# Altium schematic sheet Ethernet-PoE-Sheet.SchDoc (part 3 of 3)
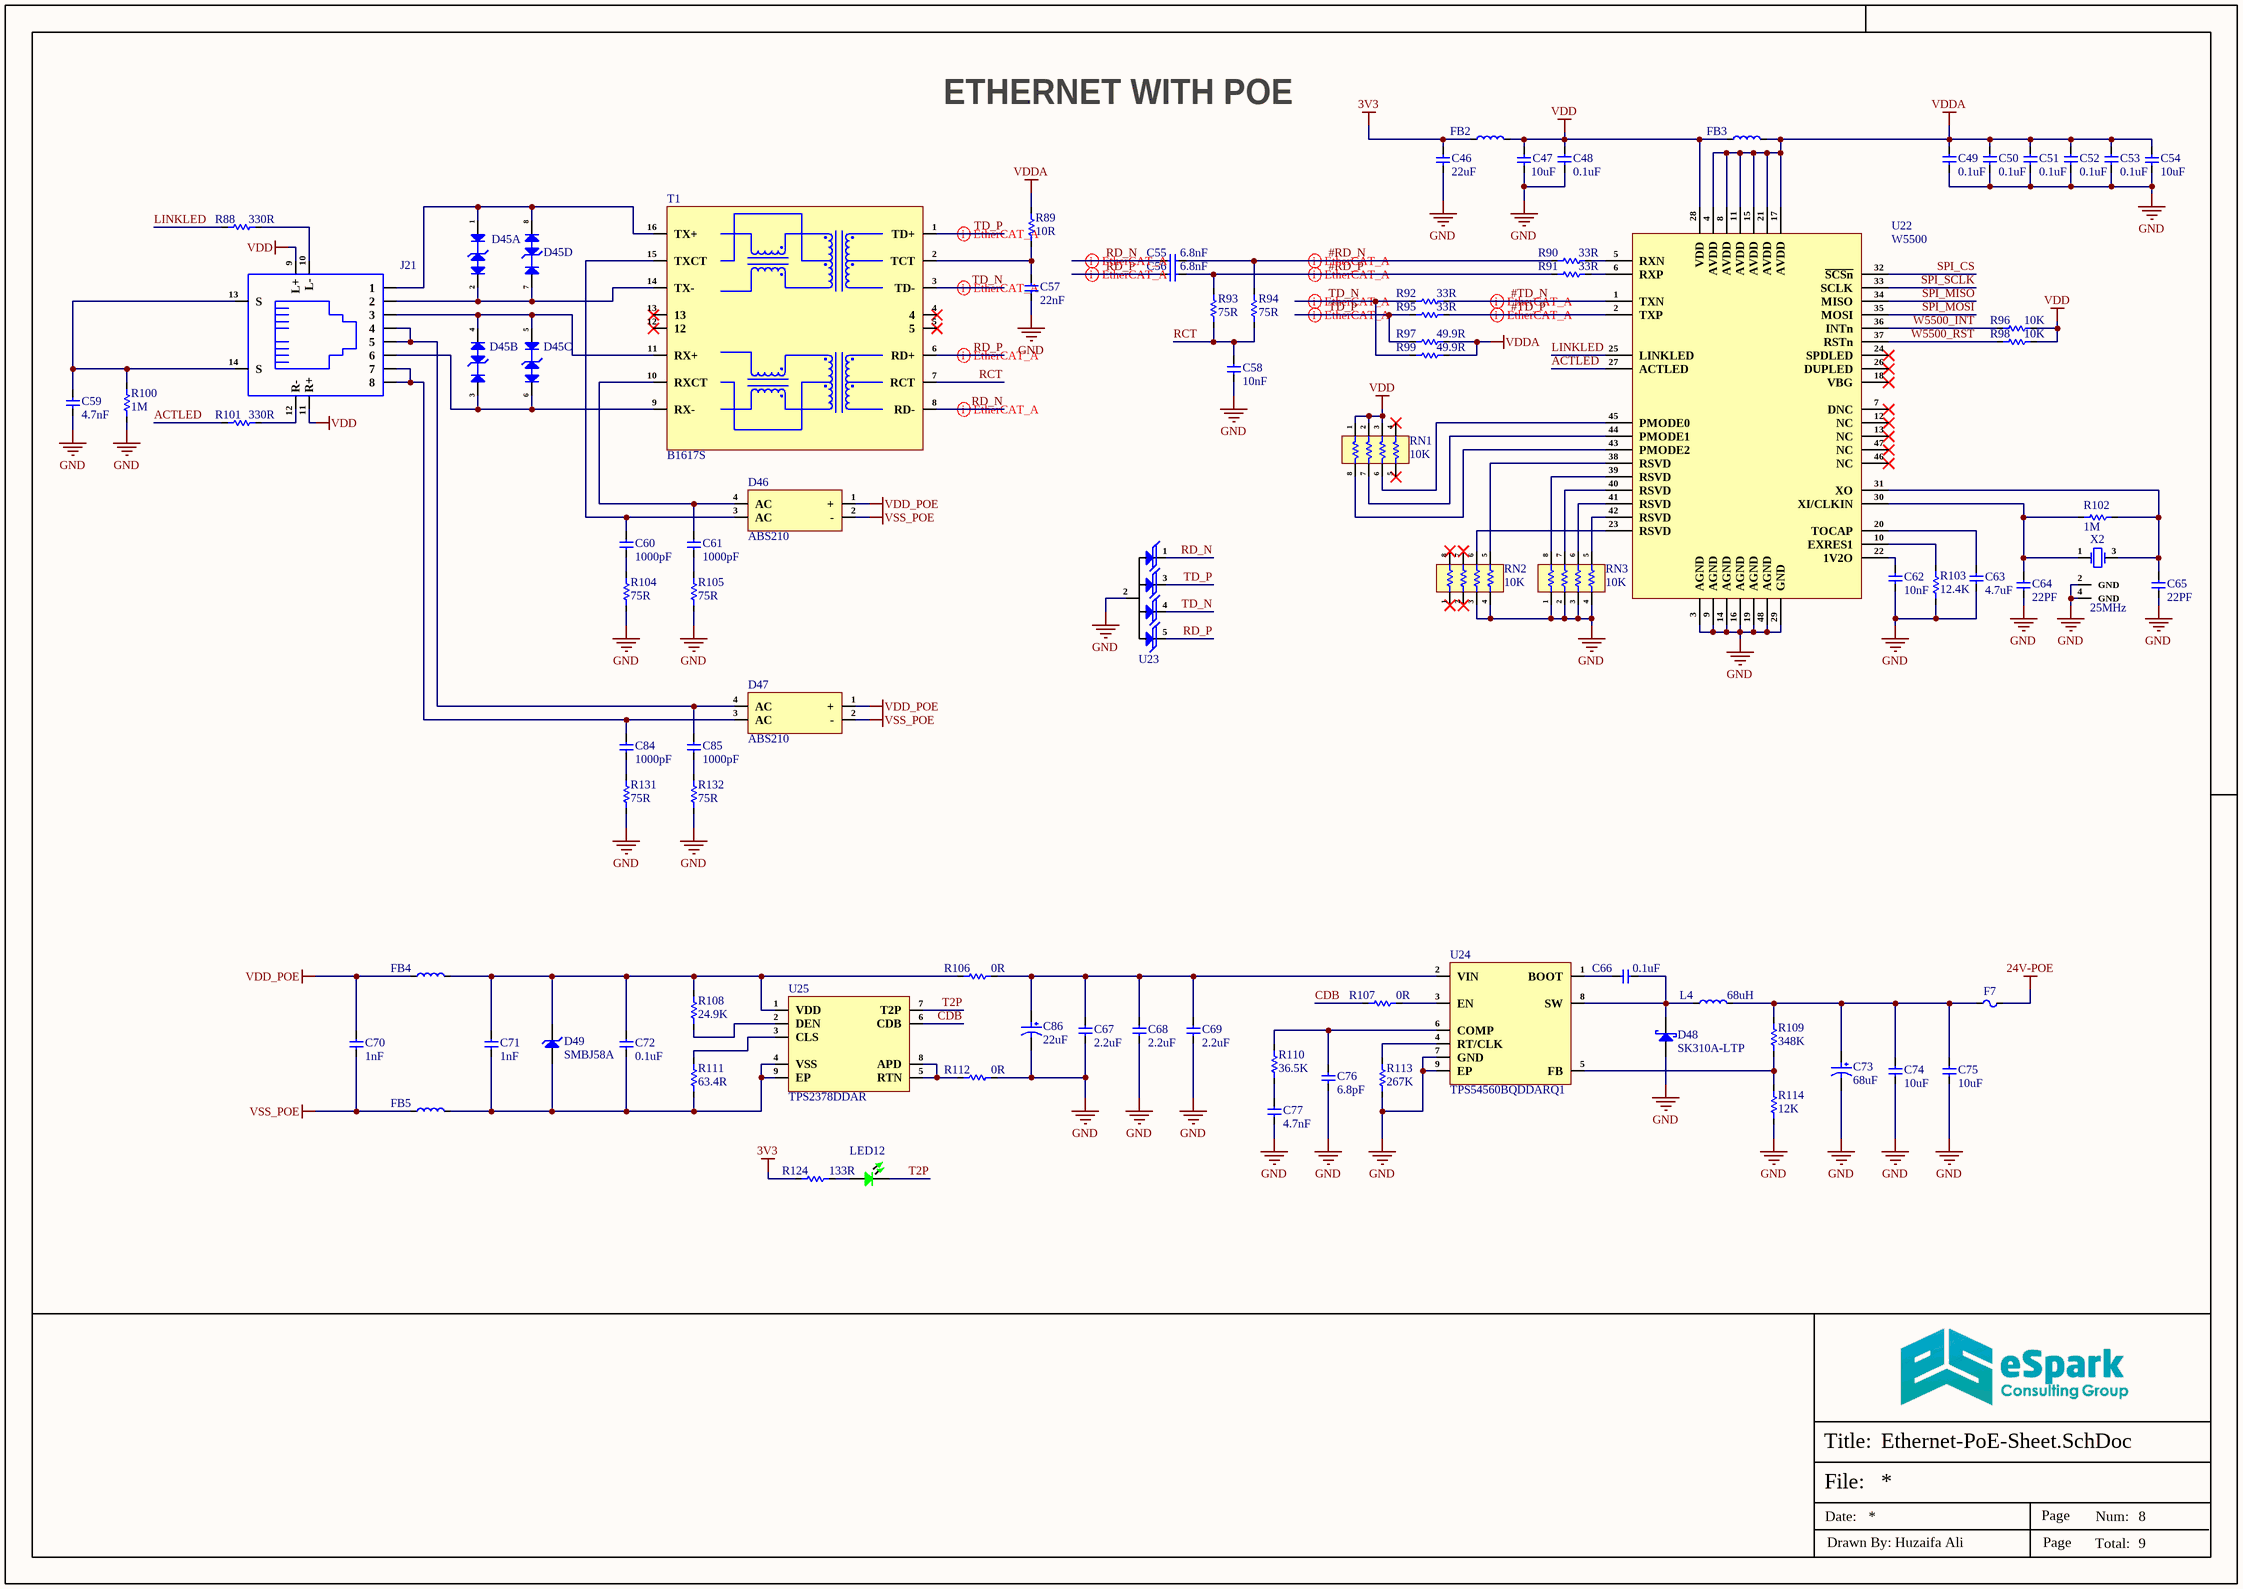
[diagram p2: Ethernet-PoE-Sheet.SchDoc]

## Library data of the parts (continued)
R102 = RK73H1ETTP1004F: Res Thick Film 0402 1M Ohm 1% 0.1W(1/10W) ±100ppm/C Pad SMD Automotive T/R; Manufacturer: KOA Speer; Resistance: 1MR; Power Rating: 63mW; Voltage Rating: 50V; Temperature Coefficient: 100ppm/°C; Max Power Dissipation: 100mW; Item Type: Resistor; Supplier 1: Rs; Manufacturer Part Number: RK73H1ETTP1004F; RoHS: Yes; Category: Chip SMD Resistors; Stock 1: 29500; Pricing 1: 100=0.003, 1000=0.006, 2500=0.005, 5000=0.005, 10000=0.004 (GBP); Mount: Surface Mount; Case/Package: 0402; Case Code (Imperial): 0402; Case Code (Metric): 1005; Min Operating Temperature: -55°C; Max Operating Temperature: 155°C; Packaging: Tape and Reel; Tolerance: 1%; Package Quantity: 10000; Termination: SMD/SMT; Series: RK73H; Construction: Rectangular; Technology: THICK FILM; Features: Moisture Resistant,Automotive AEC-Q200; Number of Terminations: 2; Voltage Rating (DC): 50V; Length: 1mm; Width: 0.5mm; Height: 0.35mm; Depth: 0.5mm; Ratings: AEC-Q200; Military Standard: Not; RoHS Compliant: Yes; Lead Free: 5697LeadFree; ComponentLink1URL: http://www.jameco.com/Jameco/Products/ProdDS/1882463.pdf?src-supplier=Jameco; ComponentLink1Description: http://www.jameco.com/Jameco/Products/ProdDS/1882463.pdf?src-supplier=Jameco; ComponentLink2URL: http://components.arrow.com/part/dataview/39721833S6492602N5146?src-supplier=Arrow+Electronics; ComponentLink2Description: http://components.arrow.com/part/dataview/39721833S6492602N5146?src-supplier=Arrow+Electronics; ComponentLink3URL: https://datasheet.octopart.com/RK73H1ETTP1004F-KOA-Speer-datasheet-149653815.pdf?src-supplier=Farnell; ComponentLink3Description: https://datasheet.octopart.com/RK73H1ETTP1004F-KOA-Speer-datasheet-149653815.pdf?src-supplier=Farnell; ComponentLink4URL: http://www.koaspeer.com/catimages/Products/RK73H/RK73H.pdf?src-supplier=Mouser; ComponentLink4Description: http://www.koaspeer.com/catimages/Products/RK73H/RK73H.pdf?src-supplier=Mouser; ComponentLink5URL: https://www.verical.com/server-webapp/html/getDatasheet?partID=139303&src-supplier=Verical; ComponentLink5Description: https://www.verical.com/server-webapp/html/getDatasheet?partID=139303&src-supplier=Verical; LCSC Part Number: C159943
R103 = RC0603FR-0712K4L: RES SMD 12.4K OHM 1% 1/10W 0603; Manufacturer: Yageo; Resistance: 12.4kR; Power Rating: 100mW; Voltage Rating: 50V; Temperature Coefficient: 100ppm/°C; Working Voltage: 75V; Supplier 1: Digi-Key; Manufacturer Part Number: RC0603FR-0712K4L; RoHS: Yes; Category: Chip SMD Resistors; Stock 1: 494008; Pricing 1: 1=0.10000, 10=0.02400, 100=0.00970, 1000=0.00436, 2500=0.00378 (USD); Case/Package: 0603; Case Code (Metric): 1608; Case Code (Imperial): 0603; Min Operating Temperature: -55°C; Max Operating Temperature: 155°C; Packaging: Tape and Reel; Tolerance: 1%; Package Quantity: 1; Resistor Type: Thick Film; Number of Terminations: 2; Termination: SMD/SMT; Max Power Dissipation: 100mW; Voltage Rating (DC): 50V; Features: Moisture Resistant; Series: RC; Construction: Rectangular; Technology: THICK FILM; Length: 0.063inch; Width: 0.031inch; Height: 0.022inch; Depth: 0.8mm; Military Standard: Not; Lead Free: Lead Free; RoHS Compliant: Yes; ComponentLink1URL: https://datasheet.ciiva.com/2454/pyu-r-int-thick-7-2454069.pdf?src-supplier=Digi-Key; ComponentLink1Description: https://datasheet.ciiva.com/2454/pyu-r-int-thick-7-2454069.pdf?src-supplier=Digi-Key; ComponentLink2URL: https://datasheet.ciiva.com/2454/pyu-r-int-thick-7-2454070.pdf?src-supplier=Digi-Key; ComponentLink2Description: https://datasheet.ciiva.com/2454/pyu-r-int-thick-7-2454070.pdf?src-supplier=Digi-Key; ComponentLink3URL: https://datasheet.ciiva.com/2454/pyu-r-int-thick-7-2454071.pdf?src-supplier=Digi-Key; ComponentLink3Description: https://datasheet.ciiva.com/2454/pyu-r-int-thick-7-2454071.pdf?src-supplier=Digi-Key; Supplier Part Number 1: 311-12.4KHRCT-ND; LCSC Part Number: C137798
R106 R112 = RC0805FR-070RL: RES 0 OHM JUMPER 1/8W 0805; Manufacturer: Yageo; Resistance: 0mR; Tolerance: 1%; Power Rating: 125mW; Item Type: Resistor; Supplier 1: Avnet; Manufacturer Part Number: RC0805FR-070RL; RoHS: Yes; Category: Chip SMD Resistors; Stock 1: 85000; Pricing 1: 5000=0.00281, 10000=0.00277, 20000=0.00269 (USD); Case/Package: 0805; Contact Plating: Tin,Matte; Case Code (Imperial): 0805; Case Code (Metric): 2012; Size Code: 0805; Min Operating Temperature: -55°C; Max Operating Temperature: 155°C; Resistor Type: Thick Film; Packaging: Tape and Reel; Features: Moisture Resistant; Series: RC; Max Power Dissipation: 125mW; Number of Terminations: 2; Construction: Rectangular; Length: 2mm; Depth: 1.25mm; Radiation Hardening: No; Military Standard: Not; Lead Free: Lead Free; RoHS Compliant: Yes; ComponentLink1URL: https://datasheet.ciiva.com/15189/getdatasheetpartid-348154-15189885.pdf?src-supplier=Verical; ComponentLink1Description: https://datasheet.ciiva.com/15189/getdatasheetpartid-348154-15189885.pdf?src-supplier=Verical; ComponentLink2URL: https://datasheet.ciiva.com/17042/rc0805-17042698.pdf?src-supplier=Future+Electronics; ComponentLink2Description: https://datasheet.ciiva.com/17042/rc0805-17042698.pdf?src-supplier=Future+Electronics; Supplier Part Number 1: RC0805FR-070RL; LCSC Part Number: C100045
R107 = RC0402FR-070RL: RES 0 OHM JUMPER 1/16W 0402; Manufacturer: Yageo; Item Type: Resistors; Tolerance: 1%; Power Rating: 62.5mW; Voltage Rating: 50V; Temperature Coefficient: 200ppm/°C; Max Power Dissipation: 63mW; Supplier 1: Mouser; Manufacturer Part Number: RC0402FR-070RL; RoHS: Yes; Stock 1: 8556842; Pricing 1: 1=0.10000, 10=0.01400, 50=0.01400, 100=0.00600, 1000=0.00300, 5000=0.00200, 10000=0.00100 (USD); Mount: Surface Mount; Case/Package: 0402; Contact Plating: Tin,Matte; Case Code (Imperial): 0402; Case Code (Metric): 1005; Size Code: 0402; Min Operating Temperature: -55°C; Max Operating Temperature: 155°C; Resistance: 0R; Resistor Type: Thick Film; Packaging: Tape and Reel; Termination: SMD/SMT; Features: Moisture Resistant; Series: RC; Number of Terminations: 2; Length: 1mm; Width: 0.5mm; Height: 0.35mm; Radiation Hardening: No; Lead Free: Lead Free; RoHS Compliant: Yes; ComponentLink1URL: https://datasheet.ciiva.com/8896/pyu-rc0402-51-rohs-l-6-8896149.pdf?src-supplier=Avnet; ComponentLink1Description: https://datasheet.ciiva.com/8896/pyu-rc0402-51-rohs-l-6-8896149.pdf?src-supplier=Avnet; ComponentLink2URL: https://datasheet.ciiva.com/16790/pyu-rc0402-51-rohs-l-6-r-16790444.pdf?src-supplier=Future+Electronics; ComponentLink2Description: https://datasheet.ciiva.com/16790/pyu-rc0402-51-rohs-l-6-r-16790444.pdf?src-supplier=Future+Electronics; Supplier Part Number 1: 603-RC0402FR-070RL; LCSC Part Number: C106231
R108 = 0603WAF2492T5E: 100mW Thick Film Resistors 75V ±100ppm/℃ ±1% 24.9kΩ 0603 Chip Resistor - Surface Mount ROHS; Manufacturer: UNI-ROYAL(Uniroyal Elec); Manufacturer Part Number: 0603WAF2492T5E; Package: 0603; LCSC Part Number: C25962; Item Type: Resistor; ComponentLink1Description: LCSC; ComponentLink1URL: https://www.lcsc.com/product-detail/Chip-Resistor-Surface-Mount_UNI-ROYAL-Uniroyal-Elec-0603WAF2492T5E_C25962.html
R109 = RT0805BRD07348KL: RES SMD 348K OHM 0.1% 1/8W 0805; Manufacturer: Yageo; Item Type: Resistors; Value: 348kR; Voltage Rating: 150V; Power Rating: 125mW; Temperature Coefficient: 25ppm/°C; Supplier: Digikey; LCSC Part Number: C865416; Manufacturer Part Number: RT0805BRD07348KL; RoHS: Yes; Stock: 10028; Pricing: 1=0.16, 10=0.122, 50=0.0968, 100=0.0867, 500=0.06936, 1000=0.05814 (USD); Case/Package: 0805; Case Code (Metric): 2012; Case Code (Imperial): 0805; Min Operating Temperature: -55°C; Max Operating Temperature: 155°C; Tolerance: 0.1%; Packaging: Tape and Reel; Termination: SMD/SMT; Voltage Rating (DC): 150V; Series: RT; Max Power Dissipation: 125mW; Number of Terminations: 2; Width: 1.25mm; RoHS Compliant: Yes; ComponentLink1URL: https://datasheet.ciiva.com/12705/pyu-rt-1-to-0-05-rohs-l-4-12705227.pdf?src-supplier=Mouser; ComponentLink1Description: https://datasheet.ciiva.com/12705/pyu-rt-1-to-0-05-rohs-l-4-12705227.pdf?src-supplier=Mouser
R110 = RC0603FR-0736K5L: RES 36.5K OHM 1% 1/10W 0603; Manufacturer: YAGEO; Item Type: Resistor; Manufacturer Part Number: RC0603FR-0736K5L; Package: 0603; LCSC Part Number: C137738; ComponentLink1Description: LCSC; ComponentLink1URL: https://www.lcsc.com/product-detail/Chip-Resistor-Surface-Mount_YAGEO-RC0603FR-0736K5L_C137738.html
R111 = AC0603FR-0763R4L: RES SMD 63.4 OHM 1% 1/10W 0603; Manufacturer: Yageo; Item Type: Resistor; Power Rating: 100mW; Voltage Rating: 50V; Temperature Coefficient: 100ppm/°C; Supplier: Digikey; LCSC Part Number: C228004; Manufacturer Part Number: AC0603FR-0763R4L; RoHS: Yes; Stock: 4788; Pricing: 1=0.1, 10=0.021, 50=0.013, 100=0.0108, 500=0.00734, 1000=0.00633 (USD); Case/Package: 0603; Case Code (Imperial): 0603; Case Code (Metric): 1608; Weight: 7.1E-05oz; Min Operating Temperature: -55°C; Max Operating Temperature: 155°C; Tolerance: 1%; Value: 63.4R; Packaging: Tape and Reel; Termination: SMD/SMT; Number of Terminations: 2; Max Power Dissipation: 100mW; Features: Moisture Resistant,Automotive AEC-Q200; Series: AC; Length: 0.063inch; Width: 0.8mm; Height: 0.022inch; RoHS Compliant: Yes; ComponentLink1URL: https://datasheet.ciiva.com/12576/pyu-ac-51-rohs-l-2-12576614.pdf?src-supplier=Mouser; ComponentLink1Description: https://datasheet.ciiva.com/12576/pyu-ac-51-rohs-l-2-12576614.pdf?src-supplier=Mouser
R113 = RT0603BRD07267KL: RES SMD 267K OHM 0.1% 1/10W 0603; Manufacturer: Yageo; Item Type: Resistors; Value: 267kR; Power Rating: 100mW; Voltage Rating: 75V; Temperature Coefficient: 25ppm/°C; Voltage Rating (DC): 50V; Supplier: Digikey; LCSC Part Number: C705753; Manufacturer Part Number: RT0603BRD07267KL; RoHS: Yes; Stock: 12053; Pricing: 1=0.15, 10=0.106, 50=0.0846, 100=0.0755, 500=0.05814, 1000=0.051 (USD); Case/Package: 0603; Case Code (Imperial): 0603; Case Code (Metric): 1608; Weight: 7.1E-05oz; Min Operating Temperature: -55°C; Max Operating Temperature: 155°C; Packaging: Tape and Reel; Tolerance: 0.1%; Termination: SMD/SMT; Series: RT; Max Power Dissipation: 100mW; Number of Terminations: 2; Length: 1.6mm; Width: 0.8mm; Height: 0.45mm; Lead Free: Lead Free; RoHS Compliant: Yes; ComponentLink1URL: http://www.mouser.com/ds/2/447/yageodocoutput-1125656.pdf?src-supplier=Mouser; ComponentLink1Description: http://www.mouser.com/ds/2/447/yageodocoutput-1125656.pdf?src-supplier=Mouser; ComponentLink2URL: http://www.yageo.com/documents/recent/PYu-RT_1-to-0.01_RoHS_L_9.pdf?src-supplier=Digikey; ComponentLink2Description: http://www.yageo.com/documents/recent/PYu-RT_1-to-0.01_RoHS_L_9.pdf?src-supplier=Digikey
R114 = RC0603FR-0712KL: RES 12K OHM 1% 1/10W 0603; Manufacturer: Yageo; Value: 12kR; Power Rating: 100mW; Voltage Rating (DC): 50V; Temperature Coefficient: 100ppm/°C; Item Type: Resistor; Supplier: Future Electronics; Supplier Part Number: 6276984; Manufacturer Part Number: RC0603FR-0712KL; RoHS: Yes; Category: Chip SMD Resistors; Stock: 15340000; Pricing: 5000=0.0028, 75000=0.0015, 100000=0.0026, 250000=0.0014, 375000=0.0025, 750000=0.0013, 1250000=0.0024, 2500000=0.0012, 5000000=0.0022 (USD); Case/Package: 0603; Pins: 2; Case Code (Imperial): 0603; Case Code (Metric): 1608; Min Operating Temperature: -55°C; Max Operating Temperature: 155°C; Tolerance: 1%; Packaging: Tape and Reel; Resistor Type: Thick Film; Voltage Rating: 50V; Termination: SMD/SMT; Number of Terminations: 2; Max Power Dissipation: 100mW; Features: Moisture Resistant; Series: RC; Construction: Rectangular; Resistance Tolerance: 1%; Length: 1.6mm; Width: 0.8mm; Depth: 0.8mm; Reach SVHC Compliant: No; RoHS Compliant: Yes; Lead Free: 5697LeadFree; Military Standard: Not; ComponentLink1URL: https://datasheet.ciiva.com/46412/443971-46412842.pdf?src-supplier=Element14; ComponentLink1Description: https://datasheet.ciiva.com/46412/443971-46412842.pdf?src-supplier=Element14; ComponentLink2URL: https://datasheet.ciiva.com/2454/pyu-r-int-thick-7-2454283.pdf?src-supplier=Digikey; ComponentLink2Description: https://datasheet.ciiva.com/2454/pyu-r-int-thick-7-2454283.pdf?src-supplier=Digikey; ComponentLink3URL: https://datasheet.ciiva.com/2454/pyu-r-int-thick-7-2454284.pdf?src-supplier=Digikey; ComponentLink3Description: https://datasheet.ciiva.com/2454/pyu-r-int-thick-7-2454284.pdf?src-supplier=Digikey; ComponentLink4URL: https://datasheet.ciiva.com/2454/pyu-r-int-thick-7-2454282.pdf?src-supplier=Digikey; ComponentLink4Description: https://datasheet.ciiva.com/2454/pyu-r-int-thick-7-2454282.pdf?src-supplier=Digikey; ComponentLink5URL: https://datasheet.ciiva.com/7746/1784430-7746250.pdf?src-supplier=Element14; ComponentLink5Description: https://datasheet.ciiva.com/7746/1784430-7746250.pdf?src-supplier=Element14; ComponentLink6URL: https://datasheet.ciiva.com/7746/1784430-7746251.pdf?src-supplier=Element14; ComponentLink6Description: https://datasheet.ciiva.com/7746/1784430-7746251.pdf?src-supplier=Element14; LCSC Part Number: C114659
R124 = RC0402FR-07133RL: RES 133 OHM 1% 1/16W 0402; Manufacturer: Yageo; Temperature Coefficient: 100ppm/°C; Power Rating: 62.5mW; Voltage Rating: 50V; Max Power Dissipation: 63mW; Supplier 1: Mouser; Manufacturer Part Number: RC0402FR-07133RL; RoHS: Yes; Category: Chip SMD Resistors; Stock 1: 12475; Pricing 1: 1=0.10000, 10=0.01200, 50=0.01200, 100=0.00500, 1000=0.00300, 2500=0.00200, 10000=0.00100 (USD); Case/Package: 0402; Contact Plating: Tin,Matte; Case Code (Imperial): 0402; Case Code (Metric): 1005; Size Code: 0402; Min Operating Temperature: -55°C; Max Operating Temperature: 155°C; Tolerance: 1%; Resistance: 133R; Resistor Type: Thick Film; Packaging: Tape and Reel; Number of Terminations: 2; Termination: SMD/SMT; Features: Moisture Resistant; Series: RC; Construction: Rectangular; Length: 1mm; Width: 0.02inch; Height: 0.016inch; Depth: 0.5mm; Military Standard: Not; Lead Free: Lead Free; RoHS Compliant: Yes; ComponentLink1URL: https://datasheet.ciiva.com/8887/pyu-rc0402-51-rohs-l-6-8887451.pdf?src-supplier=Avnet; ComponentLink1Description: https://datasheet.ciiva.com/8887/pyu-rc0402-51-rohs-l-6-8887451.pdf?src-supplier=Avnet; Supplier Part Number 1: 603-RC0402FR-07133RL; LCSC Part Number: C327373
RN1-RN3 = YC164-FR-0710KL: RES ARRAY 4 RES 10K OHM 1206; Manufacturer: Yageo; Tolerance: 1%; Voltage Rating: 50V; Number of Elements: 4; Value: 10kR; Circuit Type: Isolated; Power Per Element: 62.5mW; Temperature Coefficient: 200ppm/°C; Item Type: Resistor Array; Supplier 1: Future Electronics; Manufacturer Part Number: YC164-FR-0710KL; RoHS: Yes; Category: Resistor Arrays; Stock 1: 25000; Pricing 1: 5000=0.0101, 20000=0.0095, 50000=0.0092, 125000=0.0089, 200000=0.0085 (USD); Mounting Technology: Surface Mount; Pins: 8; Case Code (Metric): 3216; Case Code (Imperial): 1206; Min Operating Temperature: -55°C; Max Operating Temperature: 155°C; Packaging: Tape and Reel; Number of Resistors: 4; Number of Circuits: 4; Series: YC164; Resistance Tolerance: 1%; Length: 0.126inch; Width: 0.063inch; Height: 0.028inch; Lead Free: Lead Free; RoHS Compliant: Yes; Reach SVHC Compliant: Unknown; ComponentLink1URL: http://www.farnell.com/datasheets/2167431.pdf?src-supplier=Farnell; ComponentLink1Description: http://www.farnell.com/datasheets/2167431.pdf?src-supplier=Farnell; ComponentLink2URL: https://media.digikey.com/pdf/Data%20Sheets/Yageo%20PDFs/YC102-358,TC122-164_Series_DS.pdf?src-supplier=Digi-Key; ComponentLink2Description: https://media.digikey.com/pdf/Data%20Sheets/Yageo%20PDFs/YC102-358,TC122-164_Series_DS.pdf?src-supplier=Digi-Key; ComponentLink3URL: http://www.farnell.com/datasheets/2167431.pdf?src-supplier=Element14; ComponentLink3Description: http://www.farnell.com/datasheets/2167431.pdf?src-supplier=Element14; ComponentLink4URL: http://www.farnell.com/datasheets/443424.pdf?src-supplier=Element14; ComponentLink4Description: http://www.farnell.com/datasheets/443424.pdf?src-supplier=Element14; ComponentLink5URL: http://www.farnell.com/datasheets/2167431.pdf?src-supplier=Newark; ComponentLink5Description: http://www.farnell.com/datasheets/2167431.pdf?src-supplier=Newark; Supplier Part Number 1: 5054288; LCSC Part Number: C110924
T1 = B1617S: Single port 1:1 100M POE SMD-16P,12.7x7mm Pulse Transformers(LAN) ROHS; Manufacturer: CND-tek; Manufacturer Part Number: B1617S; Package: SMD-16P,12.7x7mm; LCSC Part Number: C507597; Item Type: Transformer; ComponentLink1Description: LCSC; ComponentLink1URL: https://jlcpcb.com/partdetail/cndtek-B1617S/C507597
U22 = W5500: SPI LQFP-48(7x7) Ethernet ICs ROHS; Manufacturer: WIZNET; Item Type: IC; Manufacturer Part Number: W5500; LCSC Part Number: C32843; Package: LQFP-48(7x7); ComponentLink1Description: LCSC; ComponentLink1URL: https://www.lcsc.com/product-detail/Ethernet-ICs_WIZNET-W5500_C32843.html
U23 = SP0504BAHTG: TVS DIODE 5.5VWM 8.5VC SOT23-5; Manufacturer: Littelfuse; Direction: Unidirectional; Value: 30pF; Number of Channels: 4; Polarity: Bidirectional,Unidirectional; Breakdown Voltage: 5.5V; Clamping Voltage: 7.8V; Max Power Dissipation: 225mW; Power Line Protection: No; Leakage Current: 100nA; ESD Protection: Yes; Voltage Rating (DC): 5V; Diode Type: ZENER; Clamping Voltage-Max: 8V; Supplier 1: Future Electronics; Manufacturer Part Number: SP0504BAHTG; RoHS: Yes; Category: TVS Diodes; Stock 1: 1611; Pricing 1: 1=0.78, 15=0.685, 75=0.625, 300=0.575, 1500=0.52 (USD); Mounting Technology: Surface Mount; Case/Package: SOT-23; Pins: 5; Min Operating Temperature: -40°C; Max Operating Temperature: 85°C; Packaging: Tape and Reel; Termination: SMD/SMT; Working Voltage: 5.5V; Number of Unidirectional Channels: 4; Reverse Standoff Voltage: 5.5V; Number of Elements: 4; Peak Pulse Power: 225mW; Max Reverse Leakage Current: 100nA; Power Dissipation: 225mW; Series: SP05, SPA®; Length: 3.05mm; Width: 1.75mm; Height: 1.3mm; Depth: 1.75mm; Radiation Hardening: No; Lead Free: Lead Free; RoHS Compliant: Yes; Reach SVHC Compliant: Unknown; ComponentLink1URL: https://datasheet.ciiva.com/15143/getdatasheetpartid-152299-15143806.pdf?src-supplier=Verical; ComponentLink1Description: https://datasheet.ciiva.com/15143/getdatasheetpartid-152299-15143806.pdf?src-supplier=Verical; ComponentLink2URL: https://datasheet.ciiva.com/4509/sp05x-leadfree-4509638.pdf?src-supplier=Mouser; ComponentLink2Description: https://datasheet.ciiva.com/4509/sp05x-leadfree-4509638.pdf?src-supplier=Mouser; ComponentLink3URL: https://datasheet.ciiva.com/22697/1911798-22697943.pdf?src-supplier=Element14; ComponentLink3Description: https://datasheet.ciiva.com/22697/1911798-22697943.pdf?src-supplier=Element14; ComponentLink4URL: https://datasheet.ciiva.com/8062/littefuse-spa-sp050x-8062425.pdf?src-supplier=Element14; ComponentLink4Description: https://datasheet.ciiva.com/8062/littefuse-spa-sp050x-8062425.pdf?src-supplier=Element14; ComponentLink5URL: https://datasheet.ciiva.com/332/sp05xxba-332619.pdf?src-supplier=Digi-Key; ComponentLink5Description: https://datasheet.ciiva.com/332/sp05xxba-332619.pdf?src-supplier=Digi-Key; ComponentLink6URL: https://datasheet.ciiva.com/332/sp05xxba-332620.pdf?src-supplier=Digi-Key; ComponentLink6Description: https://datasheet.ciiva.com/332/sp05xxba-332620.pdf?src-supplier=Digi-Key; ComponentLink7URL: https://datasheet.ciiva.com/16393/sp05xxba-16393404.pdf?src-supplier=Future+Electronics; ComponentLink7Description: https://datasheet.ciiva.com/16393/sp05xxba-16393404.pdf?src-supplier=Future+Electronics; ComponentLink8URL: https://datasheet.ciiva.com/332/sp05xxba-332621.pdf?src-supplier=Digi-Key; ComponentLink8Description: https://datasheet.ciiva.com/332/sp05xxba-332621.pdf?src-supplier=Digi-Key; ComponentLink9URL: https://datasheet.ciiva.com/1268/526672-1268494.pdf?src-supplier=Element14; ComponentLink9Description: https://datasheet.ciiva.com/1268/526672-1268494.pdf?src-supplier=Element14; Supplier Part Number 1: 3283009; LCSC Part Number: C10675; Item Type: TVS Diode
U24 = TPS54560BQDDARQ1: IC REG BCK SPLIT RAIL ADJ 8SOPWR; Manufacturer: Texas Instruments; Max Supply Voltage: 60V; Min Supply Voltage: 4.5V; Nominal Supply Current: 146uA; Supplier: Mouser; Supplier Part Number: 595-TPS54560BQDDARQ1; Manufacturer Part Number: TPS54560BQDDARQ1; RoHS: Yes; Item Type: IC; Stock: 1171; Pricing: 1=6.41, 10=5.44, 50=5.44, 100=4.7, 1000=3.4, 10000=3.29 (USD); Length: 4.89mm; Width: 3.9mm; Height: 1.7mm; Thickness: 1.48mm; ComponentLink1URL: http://www.ti.com/lit/ds/symlink/tps54560b-q1.pdf?src-supplier=Digikey; ComponentLink1Description: http://www.ti.com/lit/ds/symlink/tps54560b-q1.pdf?src-supplier=Digikey; LCSC Part Number: C2072188
U25 = TPS2378DDAR: IEEE 802.3at PoE High-Power PD interface with AUX Control 8-SO PowerPAD -40 to 85; Manufacturer: Texas Instruments; Item Type: IC; Supplier: Mouser; Supplier Part Number: 595-TPS2378DDAR; Manufacturer Part Number: TPS2378DDAR; RoHS: Yes; Category: Interface ICs; Stock: 2078; Pricing: 1=1.61, 10=1.08, 50=1.08, 100=0.955, 1000=0.801, 10000=0.664 (USD); Width: 3.9mm; Thickness: 1.48mm; Lead Free: 5697LeadFree; ComponentLink1URL: https://datasheet.ciiva.com/6632/tps2378-6632081.pdf?src-supplier=Digikey; ComponentLink1Description: https://datasheet.ciiva.com/6632/tps2378-6632081.pdf?src-supplier=Digikey; ComponentLink2URL: https://datasheet.ciiva.com/26931/getdatasheetpartid-621225-26931136.pdf?src-supplier=Verical; ComponentLink2Description: https://datasheet.ciiva.com/26931/getdatasheetpartid-621225-26931136.pdf?src-supplier=Verical; LCSC Part Number: C337500
X2 = X322525MRB4SI: 25MHz 贴片晶振 18pF ±10ppm ±20ppm SMD3225-4P Crystals ROHS; Manufacturer: YXC; Supplier: LCSC; LCSC Part Number: C70593; Manufacturer Part Number: X322525MRB4SI; RoHS: No; Item Type: Crystal